# Altium schematic sheet Bus_Access.SchDoc: Skipper Bus Connection
size 297 x 210 mm; Author: Jack Herron; SheetNumber: 11; SheetTotal: 11
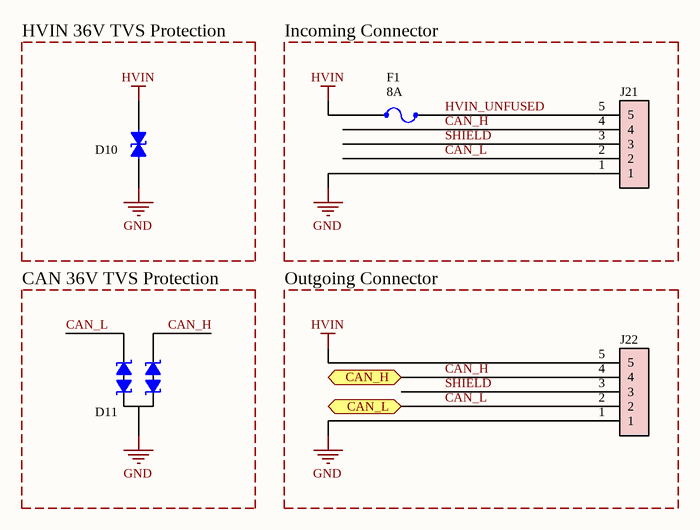
[diagram p0: Bus_Access.SchDoc]

## Parts
D10  SMBJ36CA-13-F  [DIODE-SMB_DO-214AA_BIDIRECTIONAL]  (value not drawn)
D11  PESD2CANFD36VQB-QZ  [SOT-8015]  (value not drawn)
F1  value 8A  [FUSE-1206]  (hidden comment: R12.000.8)
J21  WJ15EDGRC-3.81-05P-14-00A  [CONNECTOR_WJ15EDGRC-3.81-05P-14-00A]  (value not drawn)
J22  WJ15EDGRC-3.81-05P-14-00A  [CONNECTOR_WJ15EDGRC-3.81-05P-14-00A]  (value not drawn)

## Blocks framed on the sheet
HVIN 36V TVS Protection: D10
Incoming Connector: F1 J21
CAN 36V TVS Protection: D11
Outgoing Connector: J22

## Ports
CAN_H (bidir, see Top_Sheet[2D], CAN[5B]), CAN_L (bidir, see Top_Sheet[2D], CAN[5B])

## Nets
GND: D10.1 D11.3 J21.1 J22.1
HVIN: D10.2 F1.1 J22.5
CAN_H: D11.1 J21.4 J22.4 ; port CAN_H
CAN_L: D11.2 J21.2 J22.2 ; port CAN_L
HVIN_UNFUSED: F1.2 J21.5
SHIELD: J21.3 J22.3

## Notes on the sheet
- Title:
- File:
- Date:
- Project:
- Author:

## Library data of the parts
D10 = DIODE_TVS_BIDIRECTIONAL_36-46-58.1_SMBJ36CA-13-F: TVS Diode 36V standoff, 46V breakdown, 58.1V clamp; Manufacturer 1: Diodes Inc.; Manufacturer Part Number 1: SMBJ36CA-13-F; Supplier 1: LCSC; Supplier Part Number 1: C135071
D11 = ESD-ARRAY_2-Channel_PESD2CANFD36VQB-QZ: 36V standoff ESD array; Manufacturer 1: Nexperia; Manufacturer Part Number 1: PESD2CANFD36VQB-QZ; Supplier 1: LCSC; Supplier Part Number 1: C25652470
F1 = FUSE_R12.000.8: 8A 1206 Fuse; Manufacturer 1: Reomax; Manufacturer Part Number 1: R12.000.8; Supplier 1: LCSC; Supplier Part Number 1: C5383193
J21 J22 = CONNECTOR_WJ15EDGRC-3.81-05P-14-00A: 5 pin terminal block; Manufacturer 1: Ningbo Kangnex Elec; Manufacturer Part Number 1: WJ15EDGRC-3.81-05P-14-00A; Supplier 1: LCSC; Supplier Part Number 1: C8395